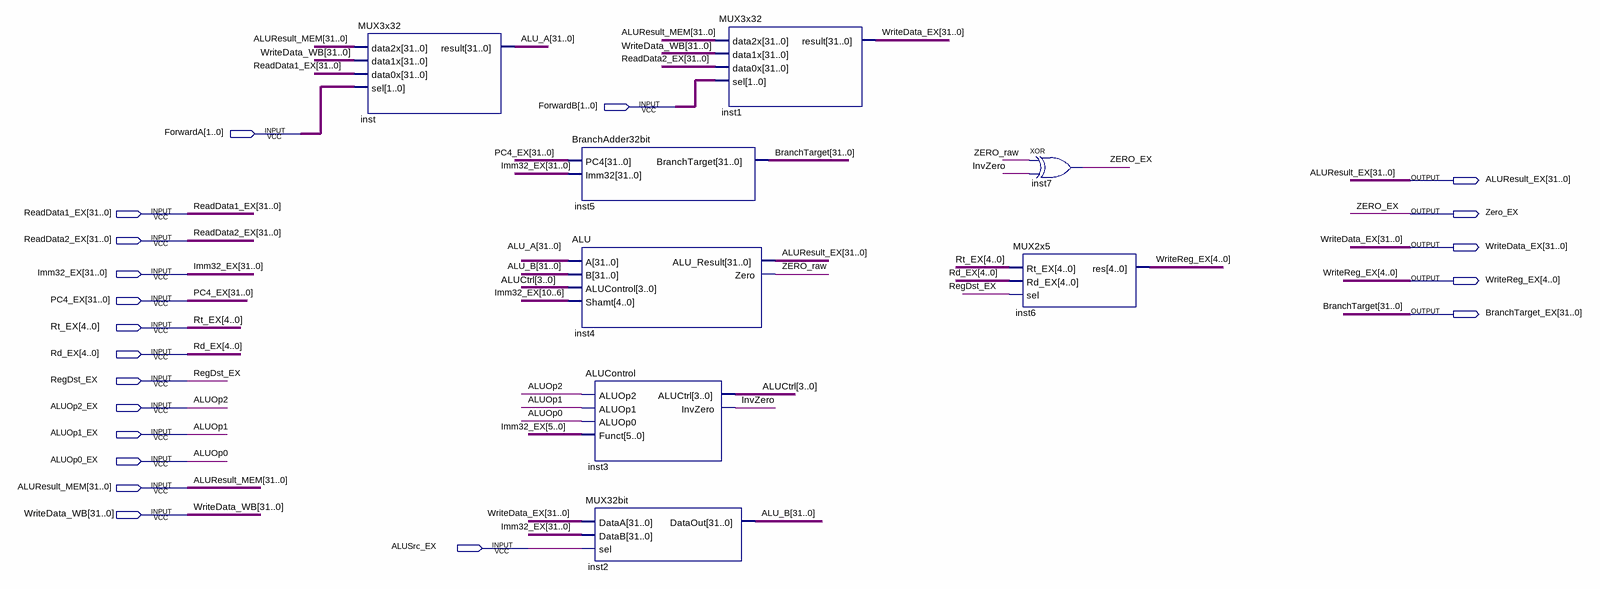
[diagram p0: schematic sheet]
// Quartus schematic EX_Stage.bdf as structural Verilog: 8 symbols, 20 pins
module EX_Stage (
  input  [1:0] ForwardB,
  input  [1:0] ForwardA,
  input  [31:0] ReadData1_EX,
  input  [31:0] ReadData2_EX,
  input  [31:0] Imm32_EX,
  input  [31:0] PC4_EX,
  input  [4:0] Rt_EX,
  input  [4:0] Rd_EX,
  input  RegDst_EX,
  input  ALUOp2_EX,
  input  ALUOp1_EX,
  input  ALUOp0_EX,
  input  [31:0] ALUResult_MEM,
  input  [31:0] WriteData_WB,
  input  ALUSrc_EX,
  output [31:0] ALUResult_EX,
  output Zero_EX,
  output [31:0] WriteData_EX,
  output [4:0] WriteReg_EX,
  output [31:0] BranchTarget_EX
);

  wire InvZero, ZERO_raw;
  wire [3:0] ALUCtrl;
  wire [31:0] ALU_A, ALU_B;

  MUX3x32 inst (.data2x(ALUResult_MEM), .data1x(WriteData_WB), .data0x(ReadData1_EX), .sel(ForwardA), .result(ALU_A));
  BranchAdder32bit inst5 (.PC4(PC4_EX), .Imm32(Imm32_EX), .BranchTarget(BranchTarget_EX));
  ALU inst4 (
    .A(ALU_A), .B(ALU_B), .ALUControl(ALUCtrl), .Shamt(Imm32_EX[10:6]), .ALU_Result(ALUResult_EX),
    .Zero(ZERO_raw));
  ALUControl inst3 (
    .ALUOp2(ALUOp2_EX), .ALUOp1(ALUOp1_EX), .ALUOp0(ALUOp0_EX), .Funct(Imm32_EX[5:0]), .ALUCtrl(ALUCtrl),
    .InvZero(InvZero));
  MUX32bit inst2 (.DataA(WriteData_EX), .DataB(Imm32_EX), .sel(ALUSrc_EX), .DataOut(ALU_B));
  MUX3x32 inst1 (
    .data2x(ALUResult_MEM), .data1x(WriteData_WB), .data0x(ReadData2_EX), .sel(ForwardB),
    .result(WriteData_EX));
  xor inst7 (Zero_EX, ZERO_raw, InvZero);
  MUX2x5 inst6 (.Rt_EX(Rt_EX), .Rd_EX(Rd_EX), .sel(RegDst_EX), .res(WriteReg_EX));

  // Other names for the same wires on the sheet: ALUOp0 = ALUOp0_EX; ALUOp1 = ALUOp1_EX; ALUOp2 = ALUOp2_EX;
  //   BranchTarget[31:0] = BranchTarget_EX
endmodule
